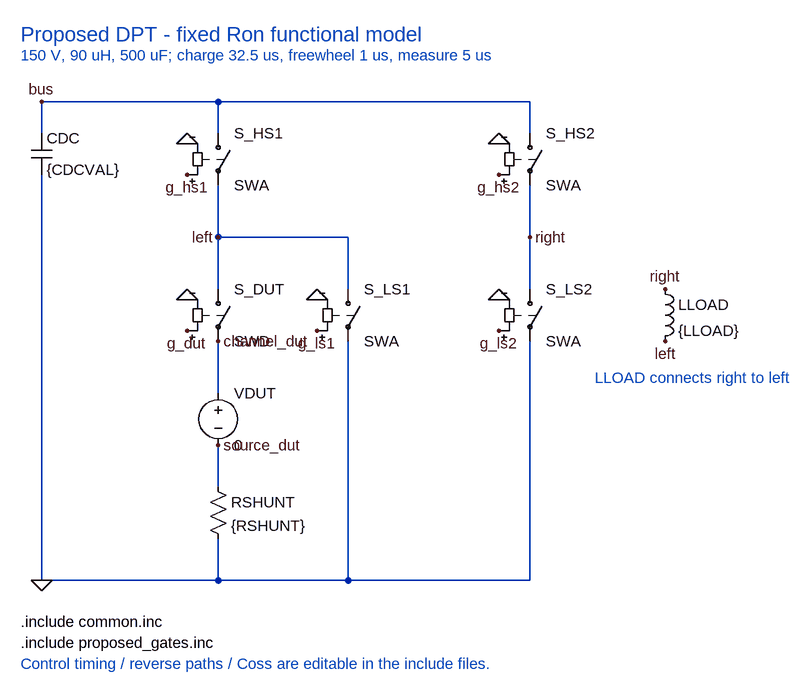
[diagram p0: schematic proposed.asc]
proposed.asc, the LTspice schematic file:
Version 4
SHEET 1 1250 1080
WIRE 128 128 880 128
WIRE 400 176 400 128
WIRE 880 176 880 128
WIRE 400 256 400 336
WIRE 880 256 880 336
WIRE 400 416 400 336
WIRE 600 416 600 336
WIRE 600 336 400 336
WIRE 880 416 880 336
WIRE 400 496 400 576
WIRE 400 656 400 720
WIRE 400 800 400 864
WIRE 600 496 600 864
WIRE 880 496 880 864
WIRE 128 240 128 864
WIRE 128 864 880 864
WIRE 128 176 128 128
FLAG 128 128 bus
FLAG 400 336 left
FLAG 880 336 right
FLAG 128 864 0
FLAG 400 496 channel_dut
FLAG 400 656 source_dut
FLAG 352 240 g_hs1
FLAG 352 192 0
SYMBOL sw 400 160 R0
SYMATTR InstName S_HS1
SYMATTR Value SWA
FLAG 832 240 g_hs2
FLAG 832 192 0
SYMBOL sw 880 160 R0
SYMATTR InstName S_HS2
SYMATTR Value SWA
FLAG 352 480 g_dut
FLAG 352 432 0
SYMBOL sw 400 400 R0
SYMATTR InstName S_DUT
SYMATTR Value SWD
FLAG 552 480 g_ls1
FLAG 552 432 0
SYMBOL sw 600 400 R0
SYMATTR InstName S_LS1
SYMATTR Value SWA
FLAG 832 480 g_ls2
FLAG 832 432 0
SYMBOL sw 880 400 R0
SYMATTR InstName S_LS2
SYMATTR Value SWA
SYMBOL cap 112 176 R0
SYMATTR InstName CDC
SYMATTR Value {CDCVAL}
SYMATTR SpiceLine IC={VDC}
SYMBOL voltage 400 560 R0
SYMATTR InstName VDUT
SYMATTR Value 0
SYMBOL res 384 704 R0
SYMATTR InstName RSHUNT
SYMATTR Value {RSHUNT}
SYMBOL ind 1072 400 R0
SYMATTR InstName LLOAD
SYMATTR Value {LLOAD}
FLAG 1088 416 right
FLAG 1088 496 left
TEXT 96 928 Left 2 !.include common.inc
TEXT 96 960 Left 2 !.include proposed_gates.inc
TEXT 96 24 Left 3 ;Proposed DPT - fixed Ron functional model
TEXT 96 56 Left 2 ;150 V, 90 uH, 500 uF; charge 32.5 us, freewheel 1 us, measure 5 us
TEXT 980 552 Left 2 ;LLOAD connects right to left
TEXT 96 992 Left 2 ;Control timing / reverse paths / Coss are editable in the include files.

The netlist it stands for:
* proposed.asc
S_HS1 bus left g_hs1 0 SWA
S_HS2 bus right g_hs2 0 SWA
S_DUT left channel_dut g_dut 0 SWD
S_LS1 left 0 g_ls1 0 SWA
S_LS2 right 0 g_ls2 0 SWA
CDC bus 0 {CDCVAL} IC={VDC}
VDUT channel_dut source_dut 0
RSHUNT source_dut 0 {RSHUNT}
LLOAD right left {LLOAD}
.include common.inc
.include proposed_gates.inc
* Proposed DPT - fixed Ron functional model
* 150 V, 90 uH, 500 uF; charge 32.5 us, freewheel 1 us, measure 5 us
* LLOAD connects right to left
* Control timing / reverse paths / Coss are editable in the include files.
.backanno
.end